# Altium schematic sheet FPC.SchDoc
size A; Organization: Altium Limited; Address1: L3, 12a Rodborough Rd; Address2: Frenchs Forest; Address3: NSW; Address4: Australia 2086
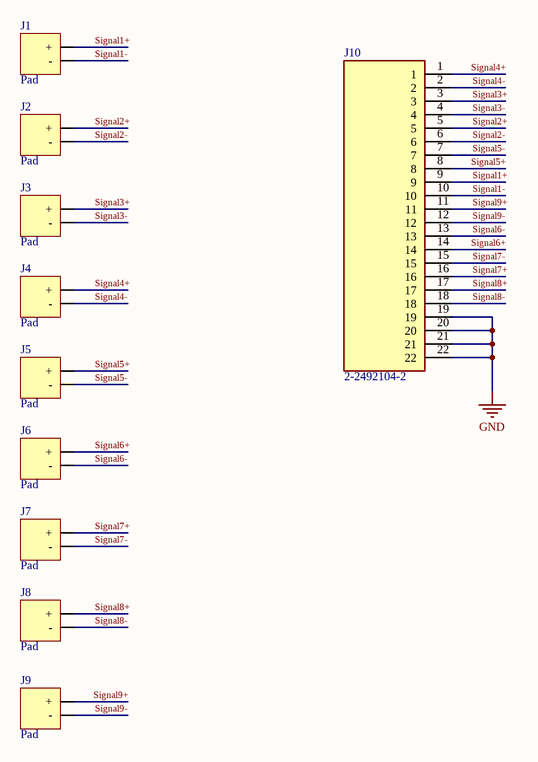
[diagram p0: FPC.SchDoc]

## Parts
J1  Pad  [PCBComponent_1]
J2  Pad  [PCBComponent_1]
J3  Pad  [PCBComponent_1]
J4  Pad  [PCBComponent_1]
J5  Pad  [PCBComponent_1]
J6  Pad  [PCBComponent_1]
J7  Pad  [PCBComponent_1]
J8  Pad  [PCBComponent_1]
J9  Pad  [PCBComponent_1]
J10  2-2492104-2  [324921046]

## Nets
GND: J10.19 J10.20 J10.21 J10.22
Signal1+: J1.1(+) J10.9
Signal1-: J1.2(-) J10.10
Signal2+: J2.1(+) J10.5
Signal2-: J2.2(-) J10.6
Signal3+: J3.1(+) J10.3
Signal3-: J3.2(-) J10.4
Signal4+: J4.1(+) J10.1
Signal4-: J4.2(-) J10.2
Signal5+: J5.1(+) J10.8
Signal5-: J5.2(-) J10.7
Signal6+: J6.1(+) J10.14
Signal6-: J6.2(-) J10.13
Signal7+: J7.1(+) J10.16
Signal7-: J7.2(-) J10.15
Signal8+: J8.1(+) J10.17
Signal8-: J8.2(-) J10.18
Signal9+: J9.1(+) J10.11
Signal9-: J9.2(-) J10.12

## Notes on the sheet
- Title
- Size:
- Date:
- A
- Number:
- Time:
- Revision:
- Sheet
- of
- File:

## Library data of the parts
J10 = 2-2492104-2: .5 mm [.02 in] Centerline, Zero Insertion Force (ZIF), Right Angle, Surface Mount, Stuffer Actuator, Gold Flash, 36 Position, FPC Connectors; Manufacturer_Name: TE Connectivity; Manufacturer_Part_Number: 3-2492104-6; Geometry.Height: 2.25mm; Mouser Part Number: *; Mouser Price/Stock: *; Datasheet Link: https://www.te.com/commerce/DocumentDelivery/DDEController?Action=srchrtrv&DocNm=2492104&DocType=Customer%20Drawing&DocLang=English&DocFormat=pdf&PartCntxt=3-2492104-6